# Altium schematic sheet SDMMC.SchDoc: Skipper SD Card Slot
size 297 x 210 mm; Author: Jack Herron; SheetNumber: 5; SheetTotal: 11
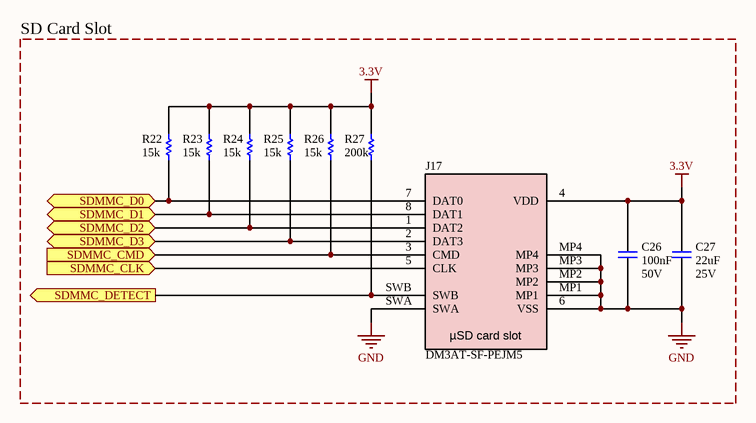
[diagram p0: SDMMC.SchDoc]

## Parts
C26  value 100nF  Voltage: 50V  [CAPACITOR-0402]  (hidden comment: CL05B104KB54PNC)
C27  value 22uF  Voltage: 25V  [CAPACITOR-1206]  (hidden comment: CL31A226KAHNNNE)
J17  DM3AT-SF-PEJM5  [CONNECTOR_MICRO-SD_DM3AT-SF-PEJM5]
R22  value 15k  [RESISTOR-0402]  (hidden comment: 0402WGF1502TCE)
R23  value 15k  [RESISTOR-0402]  (hidden comment: 0402WGF1502TCE)
R24  value 15k  [RESISTOR-0402]  (hidden comment: 0402WGF1502TCE)
R25  value 15k  [RESISTOR-0402]  (hidden comment: 0402WGF1502TCE)
R26  value 15k  [RESISTOR-0402]  (hidden comment: 0402WGF1502TCE)
R27  value 200k  [RESISTOR-0402]  (hidden comment: 0402WGF2003TCE)

## Blocks framed on the sheet
SD Card Slot: C26 C27 J17 R22-R27

## Ports
SDMMC_CLK (in, see Top_Sheet[2C], MCU_IO[2D]), SDMMC_CMD (in, see Top_Sheet[2C], MCU_IO[1C]), SDMMC_D0 (bidir, see Top_Sheet[2C], MCU_IO[1C]), SDMMC_D1 (bidir, see Top_Sheet[2C], MCU_IO[1C]), SDMMC_D2 (bidir, see Top_Sheet[2C], MCU_IO[1C]), SDMMC_D3 (bidir, see Top_Sheet[2C], MCU_IO[1C]), SDMMC_DETECT (out, see Top_Sheet[2C], MCU_IO[3B])

## Nets
3.3V: C26.2 C27.2 J17.4(VDD) R22.2 R23.2 R24.2 R25.2 R26.2 R27.2
GND: C26.1 C27.1 J17.6(VSS) J17.MP1 J17.MP2 J17.MP3 J17.MP4 J17.SWA
SDMMC_CLK: J17.5(CLK) ; port SDMMC_CLK
SDMMC_CMD: J17.3(CMD) R26.1 ; port SDMMC_CMD
SDMMC_D0: J17.7(DAT0) R22.1 ; port SDMMC_D0
SDMMC_D1: J17.8(DAT1) R23.1 ; port SDMMC_D1
SDMMC_D2: J17.1(DAT2) R24.1 ; port SDMMC_D2
SDMMC_D3: J17.2(DAT3) R25.1 ; port SDMMC_D3
SDMMC_DETECT: J17.SWB R27.1 ; port SDMMC_DETECT

## Notes on the sheet
- Title:
- File:
- Date:
- Project:
- Author:
- (in symbol CONNECTOR_MICRO-SD_DM3AT-SF-PEJM5) µSD card slot

## Library data of the parts
C26 = CAPACITOR_CL05B104KB54PNC: Capacitor - 100nF - 50V - 0402 - X7R; Manufacturer 1: Samsung; Manufacturer Part Number 1: CL05B104KB54PNC; Supplier 1: LCSC; Supplier Part Number 1: C307331
C27 = CAPACITOR_CL31A226KAHNNNE: Capacitor - 22uF - 25V - 1206; Manufacturer 1: Samsung; Manufacturer Part Number 1: CL31A226KAHNNNE; Supplier 1: LCSC; Supplier Part Number 1: C12891
J17 = CONNECTOR_MICRO-SD_DM3AT-SF-PEJM5: Micro SD Card scoket; Manufacturer 1: Hirose; Manufacturer Part Number 1: DM3AT-SF-PEJM5; Supplier 1: LCSC; Supplier Part Number 1: C114218
R22-R26 = RESISTOR_0402WGF1502TCE: Resistor - 15k - 0402; Manufacturer 1: UNI-ROYAL; Voltage: 50V; Wattage: 62.5mW; Manufacturer Part Number 1: 0402WGF1502TCE; Supplier 1: LCSC; Supplier Part Number 1: C25756
R27 = RESISTOR_0402WGF2003TCE: Resistor - 200k - 0402; Manufacturer 1: UNI-ROYAL; Wattage: 62.5mW; Voltage: 50V; Manufacturer Part Number 1: 0402WGF2003TCE; Supplier 1: LCSC; Supplier Part Number 1: C25764